# Altium project Main-Board-V1.0.0.PrjPcb (part 1 of 2)
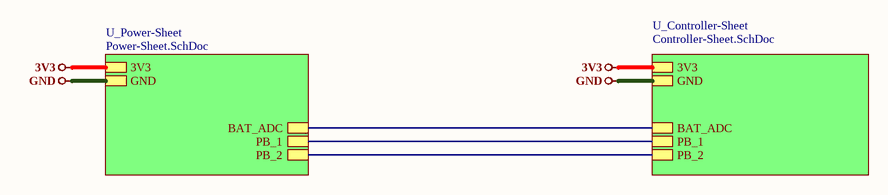
[diagram p0: Top_Sheet.SchDoc]
3 sheets, 106 parts. Net scope: hierarchical (ports join the sheet entries above them; power ports are global).
Board file: Main-Board-V1.0.0.PcbDoc
Sheets:
  Top_Sheet.SchDoc
    U_Controller-Sheet = Controller-Sheet.SchDoc
    U_Power-Sheet = Power-Sheet.SchDoc

## Sheet Top_Sheet.SchDoc
size 420 x 297 mm; SheetNumber: 1; SheetTotal: 3

### Sub-sheets
U_Controller-Sheet = Controller-Sheet.SchDoc: 3V3, GND, BAT_ADC, PB_1, PB_2
U_Power-Sheet = Power-Sheet.SchDoc: 3V3, GND, BAT_ADC, PB_1, PB_2

### Nets
3V3: sheet U_Controller-Sheet/3V3, sheet U_Power-Sheet/3V3
GND: sheet U_Controller-Sheet/GND, sheet U_Power-Sheet/GND
BATT_ADC: sheet U_Controller-Sheet/BAT_ADC, sheet U_Power-Sheet/BAT_ADC
PB_1: sheet U_Controller-Sheet/PB_1, sheet U_Power-Sheet/PB_1
PB_2: sheet U_Controller-Sheet/PB_2, sheet U_Power-Sheet/PB_2

### Notes on the sheet
- File:
- Title:
- Date:
- Page
- Num:
- Total:
- Drawn By: Huzaifa Ali

## Sheet Controller-Sheet.SchDoc
size 420 x 297 mm; SheetNumber: 3; SheetTotal: 3
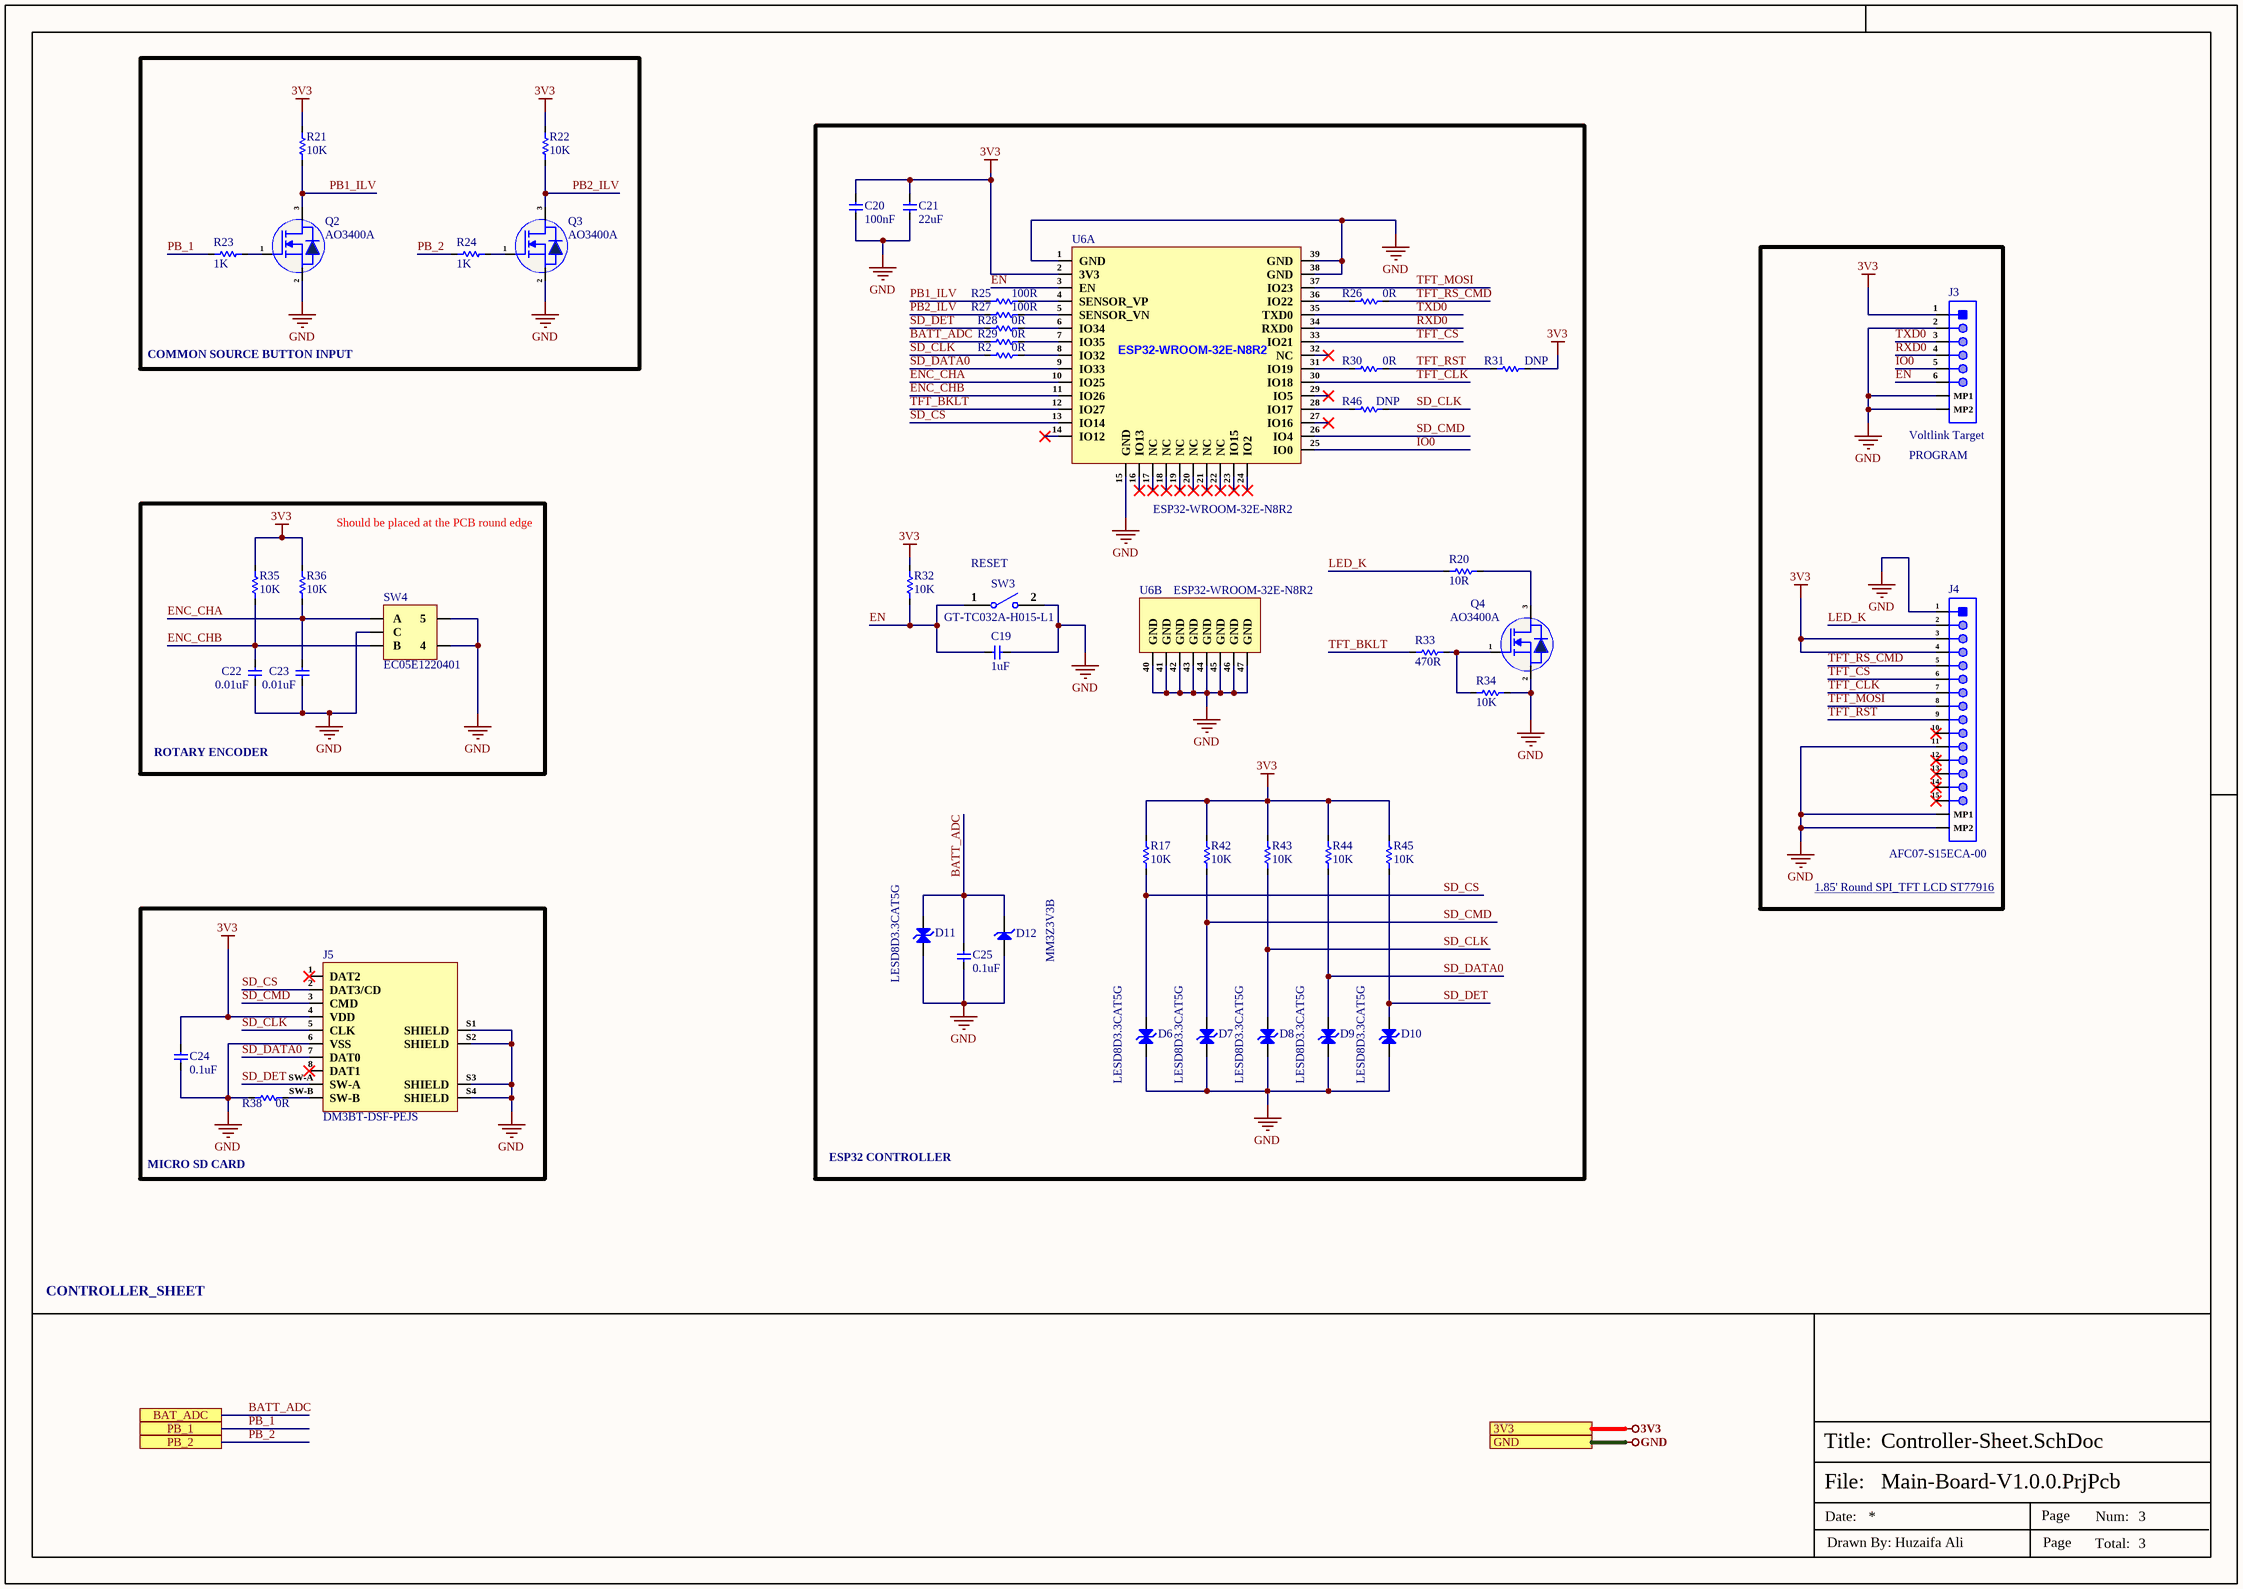
[diagram p1: Controller-Sheet.SchDoc]

### Parts
C19  1uF  [Cap-0402]
C20  100nF  [Cap-0402]
C21  22uF  [Cap-0603]
C22  0.01uF  [Cap-0402]
C23  0.01uF  [Cap-0402]
C24  0.1uF  [Cap-0402]
C25  0.1uF  [Cap-0402]
D6  LESD8D3.3CAT5G  [SOD-882 Bi Directional]
D7  LESD8D3.3CAT5G  [SOD-882 Bi Directional]
D8  LESD8D3.3CAT5G  [SOD-882 Bi Directional]
D9  LESD8D3.3CAT5G  [SOD-882 Bi Directional]
D10  LESD8D3.3CAT5G  [SOD-882 Bi Directional]
D11  LESD8D3.3CAT5G  [SOD-882 Bi Directional]
D12  MM3Z3V3B  [SOD323F]
J3  Voltlink Target  [Voltlink Target]
J4  AFC07-S15ECA-00  [AFC07-S15ECA-00]
J5  DM3BT-DSF-PEJS  [DM3BT-DSF-PEJS]
Q2  AO3400A  [sot-23]
Q3  AO3400A  [sot-23]
Q4  AO3400A  [sot-23]
R2  0R  [Res-0402]
R17  10K  [Res-0402]
R20  10R  [Res-1206]
R21  10K  [Res-0402]
R22  10K  [Res-0402]
R23  1K  [Res-0402]
R24  1K  [Res-0402]
R25  100R  [Res-0402]
R26  0R  [Res-0603]
R27  100R  [Res-0402]
R28  0R  [Res-0402]
R29  0R  [Res-0402]
R30  0R  [Res-0603]
R31  DNP  [Res-0603]
R32  10K  [Res-0402]
R33  470R  [Res-0402]
R34  10K  [Res-0402]
R35  10K  [Res-0402]
R36  10K  [Res-0402]
R38  0R  [Res-0402]
R42  10K  [Res-0402]
R43  10K  [Res-0402]
R44  10K  [Res-0402]
R45  10K  [Res-0402]
R46  DNP  [Res-0402]
SW3  GT-TC032A-H015-L1  [GT-TC032A-H015-L1]
SW4  EC05E1220401  [EC05E1220401]
U6  ESP32-WROOM-32E-N8R2  [38-SMD Module]  (parts A,B of 2)

### Blocks framed on the sheet
COMMON SOURCE BUTTON INPUT: Q2 Q3 R21-R24
MICRO SD CARD: C24 J5 R38

### Ports
3V3 (see Top_Sheet[4B], Power-Sheet[4D]), BAT_ADC (see Top_Sheet[4B], Power-Sheet[1D]), GND (see Top_Sheet[4B], Power-Sheet[4D]), PB_1 (see Top_Sheet[4B], Power-Sheet[1D]), PB_2 (see Top_Sheet[4B], Power-Sheet[1D])

### Nets
3V3: C20.2 C21.2 C24.1 J3.1 J4.3 J4.4 J5.4(VDD) R17.2 R21.2 R22.2 R31.2 R32.2 R35.2 R36.2 R42.2 R43.2 R44.2 R45.2 U6.2(3V3) ; port 3V3
GND: C19.2 C20.1 C21.1 C22.1 C23.1 C24.2 C25.1 D6.1(A) D7.1(A) D8.1(A) D9.1(A) D10.1(A) D11.1(A) D12.1(A) J3.2 J3.MP1 J3.MP2 J4.1 J4.11 J4.MP1 J4.MP2 J5.6(VSS) J5.S1(SHIELD) J5.S2(SHIELD) J5.S3(SHIELD) J5.S4(SHIELD) Q2.2(S) Q3.2(S) Q4.2(S) R34.1 R38.1 SW3.2 SW4.4 SW4.5 SW4.C U6.1(GND) U6.15(GND) U6.38(GND) U6.39(GND) U6.40(GND) U6.41(GND) U6.42(GND) U6.43(GND) U6.44(GND) U6.45(GND) U6.46(GND) U6.47(GND) ; port GND
BATT_ADC: C25.2 D11.2(A) D12.2(K) R29.1 ; port BAT_ADC
EN: C19.1 J3.6 R32.1 SW3.1 U6.3(EN)
ENC_CHA: C23.2 R36.1 SW4.A U6.10(IO25)
ENC_CHB: C22.2 R35.1 SW4.B U6.11(IO26)
IO0: J3.5 U6.25(IO0)
LED_K: J4.2 R20.1
PB1_ILV: Q2.3(D) R21.1 R25.1
PB2_ILV: Q3.3(D) R22.1 R27.1
PB_1: R23.1 ; port PB_1
PB_2: R24.1 ; port PB_2
RXD0: J3.4 U6.34(RXD0)
SD_CLK: D8.2(A) J5.5(CLK) R2.1 R43.1 R46.2
SD_CMD: D7.2(A) J5.3(CMD) R42.1 U6.26(IO4)
SD_CS: D6.2(A) J5.2(DAT3/CD) R17.1 U6.13(IO14)
SD_DATA0: D9.2(A) J5.7(DAT0) R44.1 U6.9(IO33)
SD_DET: D10.2(A) J5.SW-A R28.1 R45.1
TFT_BKLT: R33.1 U6.12(IO27)
TFT_CLK: J4.7 U6.30(IO18)
TFT_CS: J4.6 U6.33(IO21)
TFT_MOSI: J4.8 U6.37(IO23)
TFT_RS_CMD: J4.5 R26.2
TFT_RST: J4.9 R30.2 R31.1
TXD0: J3.3 U6.35(TXD0)
NetJ5_SW-B: J5.SW-B R38.2
NetQ2_1: Q2.1(G) R23.2
NetQ3_1: Q3.1(G) R24.2
NetQ4_1: Q4.1(G) R33.2 R34.2
NetQ4_3: Q4.3(D) R20.2
NetR2_2: R2.2 U6.8(IO32)
NetR25_2: R25.2 U6.4(SENSOR_VP)
NetR26_1: R26.1 U6.36(IO22)
NetR27_2: R27.2 U6.5(SENSOR_VN)
NetR28_2: R28.2 U6.6(IO34)
NetR29_2: R29.2 U6.7(IO35)
NetR30_1: R30.1 U6.31(IO19)
NetR46_1: R46.1 U6.28(IO17)

Not connected (* = marked no-connect by the designer): J4 10* 12* 13* 14* 15*; J5 1(DAT2)* 8(DAT1)*; U6 14(IO12)* 16(IO13)* 17(NC)* 18(NC)* 19(NC)* 20(NC)* 21(NC)* 22(NC)* 23(IO15)* 24(IO2)* 27(IO16)* 29(IO5)* 32(NC)*

### Notes on the sheet
- (near J3) PROGRAM
- (near R36) Should be placed at the PCB round edge
- (near SW3) RESET
- ROTARY ENCODER
- 1.85' Round SPI_TFT LCD ST77916 <https://tr.aliexpress.com/item/3256807129749103.html?spm=a2g0o.order_list.order_list_main.31.4a783d1277oQyW&gatewayAdapt=4itemAdapt#nav-specification>
- ESP32 CONTROLLER
- CONTROLLER_SHEET
- File:
- Title:
- Date:
- Page
- Num:
- Total:
- Drawn By: Huzaifa Ali

### Library data of the parts
C19 = GRM155C71C105KE11D: CAP CER 1UF 16V X7S 0402; Manufacturer: Murata; Item Type: Capacitors; Material: 4241ConductorMaterial; Tolerance: 10%; Dielectric: 1542DielectricType; Supplier: Mouser; LCSC Part Number: C576449; Manufacturer Part Number: GRM155C71C105KE11D; RoHS: No; Stock: 16102; Pricing: 1=0.11, 10=0.041, 50=0.041, 100=0.026, 1000=0.023, 10000=0.016 (USD); Case/Package: 343Case; Min Operating Temperature: -55°C; Max Operating Temperature: 125°C; Value: 1uF; Voltage Rating: 16V; Voltage Rating (DC): 16V; Length: 1mm; Width: 500um; Height: 600um; Thickness: 500um
C20 = CC0402KRX5R8BB104: CAP CER 0.1UF 25V X5R 0402; Manufacturer: Yageo; Tolerance: 10%; Item Type: Capacitor; Supplier 1: Digi-Key; Manufacturer Part Number: CC0402KRX5R8BB104; RoHS: Yes; Category: Ceramic Capacitors; Stock 1: 4598218; Pricing 1: 1=0.10000, 10=0.03800, 50=0.02100, 100=0.01710, 500=0.01224, 1000=0.00961, 2500=0.00874, 5000=0.00804 (USD); Mount: Surface Mount; Case/Package: 0402; Case Code (Metric): 1005; Case Code (Imperial): 0402; Min Operating Temperature: -55°C; Max Operating Temperature: 85°C; Voltage Rating: 25V; Packaging: Tape and Reel; Capacitance: 100nF; Voltage Rating (DC): 25V; Dielectric: X5R; Resistor Type: Ceramic; Series: CC; Length: 0.039inch; Width: 0.02inch; Thickness: 0.022inch; Depth: 0.5mm; Lead Free: Lead Free; Halogen Free: Halogen Free; RoHS Compliant: Yes; ComponentLink1URL: http://www.mouser.com/ds/2/447/UPY-GPHC_X5R_4V-to-50V_25-1131599.pdf?src-supplier=Mouser; ComponentLink1Description: http://www.mouser.com/ds/2/447/UPY-GPHC_X5R_4V-to-50V_25-1131599.pdf?src-supplier=Mouser; ComponentLink2URL: http://www.yageo.com/documents/recent/UPY-GPHC_X5R_4V-to-50V-16.pdf?src-supplier=Future+Electronics; ComponentLink2Description: http://www.yageo.com/documents/recent/UPY-GPHC_X5R_4V-to-50V-16.pdf?src-supplier=Future+Electronics; ComponentLink3URL: http://www.yageo.com/documents/recent/UPY-GPHC_X5R_4V-to-50V_25.pdf?src-supplier=Digi-Key; ComponentLink3Description: http://www.yageo.com/documents/recent/UPY-GPHC_X5R_4V-to-50V_25.pdf?src-supplier=Digi-Key; Supplier Part Number 1: 311-1697-1-ND; LCSC Part Number: C106256
C21 = CC0603MRX5R6BB226: CAP CER 22UF 10V X5R 0603; Manufacturer: Yageo; Tolerance: 20%; Item Type: Capacitor; Supplier 1: Digi-Key; Manufacturer Part Number: CC0603MRX5R6BB226; RoHS: Yes; Category: Ceramic Capacitors; Stock 1: 19628; Pricing 1: 1=0.68000, 10=0.48000, 50=0.36300, 100=0.31610, 500=0.23416, 1000=0.19903 (USD); Mount: Surface Mount; Case/Package: 0603; Case Code (Metric): 1608; Case Code (Imperial): 0603; Weight: 7.1E-05oz; Min Operating Temperature: -55°C; Max Operating Temperature: 85°C; Packaging: Tape and Reel; Capacitance: 22uF; Voltage Rating: 10V; Dielectric: X5R; Termination: SMD/SMT; Voltage Rating (DC): 10V; Package Quantity: 4000; Length: 0.063inch; Width: 0.8mm; Height: 0.8mm; Thickness: 0.035inch; Lead Free: Lead Free; Halogen Free: Halogen Free; RoHS Compliant: Yes; ComponentLink1URL: http://www.mouser.com/ds/2/447/Yageo_UPY-GP_NP0_16V-to-50V_9-358835.pdf?src-supplier=Mouser; ComponentLink1Description: http://www.mouser.com/ds/2/447/Yageo_UPY-GP_NP0_16V-to-50V_9-358835.pdf?src-supplier=Mouser; ComponentLink2URL: http://www.yageo.com/documents/recent/UPY-GPHC_X5R_4V-to-50V_25.pdf?src-supplier=Digi-Key; ComponentLink2Description: http://www.yageo.com/documents/recent/UPY-GPHC_X5R_4V-to-50V_25.pdf?src-supplier=Digi-Key; Supplier Part Number 1: 311-1819-1-ND; LCSC Part Number: C109447
C22 C23 = CC0402KRX5R8BB103: CAP CER 10000PF 25V X5R 0402; Manufacturer: Yageo; Item Type: Capacitor; Supplier 1: Future Electronics; Manufacturer Part Number: CC0402KRX5R8BB103; RoHS: Yes; Category: Ceramic Capacitors; Stock 1: 140000; Pricing 1: 10000=0.00290, 40000=0.00270, 150000=0.00260, 250000=0.00250, 500000=0.00240 (USD); RoHS Compliant: Yes; Supplier Part Number 1: 2101932; LCSC Part Number: C576726; ComponentLink1Description: LCSC; ComponentLink1URL: https://www.lcsc.com/product-detail/Multilayer-Ceramic-Capacitors-MLCC-SMD-SMT_YAGEO-CC0402KRX5R8BB103_C576726.html
C24 C25 = CC0402JRX7R7BB104: CAP CER 0.1UF 16V X7R 0402; Manufacturer: Yageo; Material: 4241ConductorMaterial; Value: 100nF; Tolerance: 5%; Item Type: Capacitor; Supplier: Digikey; Supplier Part Number: 311-1676-1-ND; Manufacturer Part Number: CC0402JRX7R7BB104; RoHS: Yes; Category: Ceramic Capacitors; Stock: 1659111; Pricing: 1=0.1, 10=0.046, 50=0.0262, 100=0.0203, 500=0.01528, 1000=0.012, 2500=0.01091, 5000=0.01004 (USD); Mounting Technology: Surface Mount; Case/Package: 0402; Case Code (Metric): 1005; Case Code (Imperial): 0402; Min Operating Temperature: -55°C; Max Operating Temperature: 125°C; Dielectric: X7R; Packaging: Tape and Reel; Package Quantity: 10000; Voltage Rating (DC): 16V; Voltage Rating: 16V; Series: CC; Construction: Flat; Length: 0.039inch; Width: 0.02inch; Height: 0.5mm; Thickness: 0.022inch; Lead Free: Lead Free; Halogen Free: Halogen Free; RoHS Compliant: Yes; ComponentLink1URL: https://datasheet.ciiva.com/13210/upy-gphc-x7r-6-3v-to-50v-8-12304-13210152.pdf?src-supplier=Mouser; ComponentLink1Description: https://datasheet.ciiva.com/13210/upy-gphc-x7r-6-3v-to-50v-8-12304-13210152.pdf?src-supplier=Mouser; LCSC Part Number: C541464
D6-D11 = LESD8D3.3CAT5G: 5V 10V 3.3V Bi-Directional SOD-882 ESD Protection Devices ROHS; Manufacturer: LRC; Manufacturer Part Number: LESD8D3.3CAT5G; Package: SOD-882; LCSC Part Number: C172409; Item Type: Protection Device; ComponentLink1Description: LCSC; ComponentLink1URL: https://www.lcsc.com/product-detail/span-style-background-color-ff0-ESD-span-Protection-Devices_LRC-LESD8D3-3CAT5G_C172409.html
D12 = MM3Z3V3B: DIODE ZENER 3.3V 200MW SOD323F; Manufacturer: ON Semiconductor / Fairchild; Forward Voltage: 1V; Tolerance: 2%; Impedance: 89R; Max Reverse Leakage Current: 4.5uA; Test Current: 5mA; Element Configuration: Single; Supplier 1: Digi-Key; Manufacturer Part Number: MM3Z3V3B; Stock 1: 473644; Pricing 1: 1=0.22, 10=0.18, 100=0.0956, 500=0.06288, 1000=0.04276 (USD); Mount: Surface Mount; Number of Pins: 2; Weight: 0.0276g; Min Operating Temperature: -65°C; Max Operating Temperature: 150°C; Packaging: Tape and Reel; Package Quantity: 1; Max Power Dissipation: 200mW; Zener Voltage: 3.3V; Voltage Tolerance: 2%; Power Dissipation: 200mW; Working Voltage: 3.3V; Peak Reverse Current: 4.5uA; Length: 1.3mm; Height: 1mm; Width: 1.7mm; Radiation Hardening: No; REACH SVHC: No SVHC; Lead Free: Lead Free; ComponentLink1URL: http://www.onsemi.com/pub/Collateral/MM3Z9V1B-D.pdf?src-supplier=Digi-Key; ComponentLink1Description: http://www.onsemi.com/pub/Collateral/MM3Z9V1B-D.pdf?src-supplier=Digi-Key; ComponentLink2URL: http://www.mouser.com/ds/2/149/MM3Z3V3B-187166.pdf?src-supplier=Mouser; ComponentLink2Description: http://www.mouser.com/ds/2/149/MM3Z3V3B-187166.pdf?src-supplier=Mouser; ComponentLink3URL: https://www.fairchildsemi.com/datasheets/MM/MM3Z9V1B.pdf?src-supplier=Avnet; ComponentLink3Description: https://www.fairchildsemi.com/datasheets/MM/MM3Z9V1B.pdf?src-supplier=Avnet; ComponentLink4URL: http://www.farnell.com/datasheets/1706525.pdf?src-supplier=Element14; ComponentLink4Description: http://www.farnell.com/datasheets/1706525.pdf?src-supplier=Element14; Supplier Part Number 1: MM3Z3V3BCT-ND; LCSC Part Number: C2978865; Item Type: Diode
J3 = C145963: 1x6P SH 1 1mm 6 SMD,P=1mm Wire To Board / Wire To Wire Connector ROHS; Manufacturer: BOOMELE; Manufacturer Part Number: C145963; Package: SMD,P=1mm; LCSC Part Number: C145963; Item Type: Connector; ComponentLink1Description: LCSC; ComponentLink1URL: https://www.lcsc.com/product-detail/Wire-To-Board-Wire-To-Wire-Connector_BOOMELE-Boom-Precision-Elec-C145963_C145963.html
J4 = AFC07-S15ECA-00: SMD,P=0.5mm,Surface Mount，Right Angle; Manufacturer: JUSHUO; Item Type: FFC, FPC Connector; Manufacturer Part Number: AFC07-S15ECA-00; Package: SMD,P=0.5mm,Surface Mount，Right Angle; LCSC Part Number: C262588; ComponentLink1Description: LCSC; ComponentLink1URL: https://www.lcsc.com/product-detail/FFC-FPC-Flat-Flexible-Connector-Assemblies_JUSHUO-AFC07-S15ECA-00_C262588.html
J5 = DM3BT-DSF-PEJS: CONN MICRO SD CARD PUSH-PUSH R/A; Manufacturer: Hirose; Max Current Rating: 500mA; Contact Resistance: 100mR; Voltage Rating (AC): 125V; Gender: Female; Number of Contacts: 8; Connector Type: Connector,Socket; Insulation Resistance: 1GR; Pitch: 1.1mm; Item Type: SD Card Connector; Supplier 1: Future Electronics; Manufacturer Part Number: DM3BT-DSF-PEJS; RoHS: Yes; Category: Memory Connectors; Stock 1: 9600; Pricing 1: 1200=1.39000 (USD); Mount: Surface Mount,Reverse; Contact Material: Copper Alloy,Copper; Contact Plating: Gold; Housing Material: Polymer; Min Operating Temperature: -25°C; Max Operating Temperature: 85°C; Number of Rows: 1; Packaging: Tape and Reel; Current Rating: 500mA; Package Quantity: 1; Termination: Solder; Max Voltage Rating (AC): 125V; Number of Positions: 8; Orientation: Right Angle; Series: DM3; Length: 13.85mm; Width: 16.05mm; Depth: 1.83mm; Radiation Hardening: No; Reach SVHC Compliant: Yes; Lead Free: Lead Free; Flammability Rating: UL94 V-0; RoHS Compliant: Yes; ComponentLink1URL: https://datasheet.ciiva.com/683/doc-1806131255093-683387.pdf?src-supplier=Digi-Key; ComponentLink1Description: https://datasheet.ciiva.com/683/doc-1806131255093-683387.pdf?src-supplier=Digi-Key; Supplier Part Number 1: 3000978; LCSC Part Number: C597972
Q2-Q4 = AO3400A: 30V 5.8A 32mΩ@10V,5.8A 1.4W 1.4V@250uA N Channel SOT-23 MOSFETs ROHS; Manufacturer: BORN; Item Type: Mosfet; ComponentLink1Description: LCSC; ComponentLink1URL: https://www.lcsc.com/product-detail/MOSFETs_BORN-AO3400A_C344010.html; Manufacturer Part Number: AO3400A; Footprint: SOT-23; LCSC Part Number: C344010
R2 R28 R29 R38 = RC0402FR-070RL: RES 0 OHM JUMPER 1/16W 0402; Manufacturer: Yageo; Item Type: Resistors; Tolerance: 1%; Power Rating: 62.5mW; Voltage Rating: 50V; Temperature Coefficient: 200ppm/°C; Max Power Dissipation: 63mW; Supplier 1: Mouser; Manufacturer Part Number: RC0402FR-070RL; RoHS: Yes; Stock 1: 8556842; Pricing 1: 1=0.10000, 10=0.01400, 50=0.01400, 100=0.00600, 1000=0.00300, 5000=0.00200, 10000=0.00100 (USD); Mount: Surface Mount; Case/Package: 0402; Contact Plating: Tin,Matte; Case Code (Imperial): 0402; Case Code (Metric): 1005; Size Code: 0402; Min Operating Temperature: -55°C; Max Operating Temperature: 155°C; Resistance: 0R; Resistor Type: Thick Film; Packaging: Tape and Reel; Termination: SMD/SMT; Features: Moisture Resistant; Series: RC; Number of Terminations: 2; Length: 1mm; Width: 0.5mm; Height: 0.35mm; Radiation Hardening: No; Lead Free: Lead Free; RoHS Compliant: Yes; ComponentLink1URL: https://datasheet.ciiva.com/8896/pyu-rc0402-51-rohs-l-6-8896149.pdf?src-supplier=Avnet; ComponentLink1Description: https://datasheet.ciiva.com/8896/pyu-rc0402-51-rohs-l-6-8896149.pdf?src-supplier=Avnet; ComponentLink2URL: https://datasheet.ciiva.com/16790/pyu-rc0402-51-rohs-l-6-r-16790444.pdf?src-supplier=Future+Electronics; ComponentLink2Description: https://datasheet.ciiva.com/16790/pyu-rc0402-51-rohs-l-6-r-16790444.pdf?src-supplier=Future+Electronics; Supplier Part Number 1: 603-RC0402FR-070RL; LCSC Part Number: C106231
R17 R21 R22 R32 R34-R36 R42-R45 = RC0402FR-0710KL: RES 10K OHM 1% 1/16W 0402; Manufacturer: Yageo; Resistance: 10kR; Voltage Rating (DC): 50V; Temperature Coefficient: 100ppm/°C; Power Rating: 62.5mW; Max Power Dissipation: 63mW; Item Type: Resistor; Supplier 1: Mouser; Manufacturer Part Number: RC0402FR-0710KL; RoHS: Yes; Category: Chip SMD Resistors; Stock 1: 18648329; Pricing 1: 1=0.10000, 10=0.01400, 50=0.01400, 100=0.00500, 1000=0.00300, 10000=0.00200 (USD); Case/Package: 0402; Number of Pins: 2; Case Code (Imperial): 0402; Case Code (Metric): 1005; Min Operating Temperature: -55°C; Max Operating Temperature: 155°C; Resistor Type: Thick Film; Tolerance: 1%; Packaging: Tape and Reel; Voltage Rating: 50V; Termination: SMD/SMT; Working Voltage: 50V; Number of Terminations: 2; Features: Moisture Resistant; Series: RC; Resistance Tolerance: 1%; Construction: Rectangular; Length: 1mm; Width: 0.5mm; Height: 0.32mm; Depth: 0.5mm; Lead Pitch: 0.2mm; REACH SVHC: No SVHC; Lead Free: Lead Free; RoHS Compliant: Yes; Military Standard: Not; ComponentLink1URL: https://datasheet.ciiva.com/7660/38568-7660787.pdf?src-supplier=Element14; ComponentLink1Description: https://datasheet.ciiva.com/7660/38568-7660787.pdf?src-supplier=Element14; ComponentLink2URL: https://datasheet.ciiva.com/7849/1686128-7849814.pdf?src-supplier=Element14; ComponentLink2Description: https://datasheet.ciiva.com/7849/1686128-7849814.pdf?src-supplier=Element14; ComponentLink3URL: https://datasheet.ciiva.com/7983/1018594-7983486.pdf?src-supplier=Element14; ComponentLink3Description: https://datasheet.ciiva.com/7983/1018594-7983486.pdf?src-supplier=Element14; ComponentLink4URL: https://datasheet.ciiva.com/22747/1018594-22747512.pdf?src-supplier=Element14; ComponentLink4Description: https://datasheet.ciiva.com/22747/1018594-22747512.pdf?src-supplier=Element14; ComponentLink5URL: https://datasheet.ciiva.com/12667/pyu-rc0402-51-rohs-l-6-r-12667067.pdf?src-supplier=Mouser; ComponentLink5Description: https://datasheet.ciiva.com/12667/pyu-rc0402-51-rohs-l-6-r-12667067.pdf?src-supplier=Mouser; ComponentLink6URL: https://datasheet.ciiva.com/7849/1784430-7849813.pdf?src-supplier=Element14; ComponentLink6Description: https://datasheet.ciiva.com/7849/1784430-7849813.pdf?src-supplier=Element14; ComponentLink7URL: https://datasheet.ciiva.com/7849/1784430-7849815.pdf?src-supplier=Element14; ComponentLink7Description: https://datasheet.ciiva.com/7849/1784430-7849815.pdf?src-supplier=Element14; Supplier Part Number 1: 603-RC0402FR-0710KL; LCSC Part Number: C60490
R20 = RC1206FR-0710RL: RES 10 OHM 1% 1/4W 1206; Manufacturer: Yageo; Item Type: Resistor; Voltage Rating (AC): 200V; Supplier: Avnet; LCSC Part Number: C108080; Manufacturer Part Number: RC1206FR-0710RL; RoHS: Yes; Stock: 3696; Pricing: 1=0.125, 25=0.043, 50=0.034, 100=0.026 (USD); Lead Free: 5697LeadFree; ComponentLink1URL: https://datasheet.ciiva.com/11819/0900766b80c6630a-11819896.pdf?src-supplier=Rs; ComponentLink1Description: https://datasheet.ciiva.com/11819/0900766b80c6630a-11819896.pdf?src-supplier=Rs; ComponentLink2URL: https://datasheet.ciiva.com/22735/444357-22735648.pdf?src-supplier=Farnell; ComponentLink2Description: https://datasheet.ciiva.com/22735/444357-22735648.pdf?src-supplier=Farnell; ComponentLink3URL: https://datasheet.ciiva.com/29181/402303-da-01-en-smd-widerstand-chip1206-10-ohm-29181572.pdf?src-supplier=Conrad; ComponentLink3Description: https://datasheet.ciiva.com/29181/402303-da-01-en-smd-widerstand-chip1206-10-ohm-29181572.pdf?src-supplier=Conrad; ComponentLink4URL: https://datasheet.ciiva.com/2460/pyu-rc1206-51-rohs-l-4-2460048.pdf?src-supplier=Digikey; ComponentLink4Description: https://datasheet.ciiva.com/2460/pyu-rc1206-51-rohs-l-4-2460048.pdf?src-supplier=Digikey; ComponentLink5URL: https://datasheet.ciiva.com/2460/pyu-rc1206-51-rohs-l-4-2460049.pdf?src-supplier=Digikey; ComponentLink5Description: https://datasheet.ciiva.com/2460/pyu-rc1206-51-rohs-l-4-2460049.pdf?src-supplier=Digikey; ComponentLink6URL: https://datasheet.ciiva.com/2460/pyu-rc1206-51-rohs-l-4-2460050.pdf?src-supplier=Digikey; ComponentLink6Description: https://datasheet.ciiva.com/2460/pyu-rc1206-51-rohs-l-4-2460050.pdf?src-supplier=Digikey; ComponentLink7URL: https://datasheet.ciiva.com/46445/444357-46445704.pdf?src-supplier=Element14; ComponentLink7Description: https://datasheet.ciiva.com/46445/444357-46445704.pdf?src-supplier=Element14; ComponentLink8URL: https://datasheet.ciiva.com/16962/pyu-rc1206-51-rohs-l-4-16962857.pdf?src-supplier=Future+Electronics; ComponentLink8Description: https://datasheet.ciiva.com/16962/pyu-rc1206-51-rohs-l-4-16962857.pdf?src-supplier=Future+Electronics
R23 R24 = RC0402FR-071KL: RES 1K OHM 1% 1/16W 0402; Manufacturer: Yageo; Resistance: 1kR; Temperature Coefficient: 100ppm/°C; Voltage Rating (DC): 50V; Power Rating: 62.5mW; Max Power Dissipation: 63mW; Item Type: Resistor; Supplier 1: Avnet; Manufacturer Part Number: RC0402FR-071KL; RoHS: Yes; Category: Chip SMD Resistors; Stock 1: 13030000; Pricing 1: 10000=0.00085, 20000=0.00087, 40000=0.00084, 60000=0.00083, 80000=0.00079, 100000=0.00078, 1000000=0.00076 (USD); Case/Package: 0402; Number of Pins: 2; Case Code (Imperial): 0402; Case Code (Metric): 1005; Size Code: 0402; Min Operating Temperature: -55°C; Max Operating Temperature: 155°C; Resistor Type: Thick Film; Tolerance: 1%; Packaging: Tape and Reel; Voltage Rating: 50V; Termination: SMD/SMT; Features: Moisture Resistant; Series: RC; Number of Terminations: 2; Resistance Tolerance: 1%; Construction: Rectangular; Technology: THICK FILM; Length: 1mm; Width: 0.5mm; Height: 0.32mm; Depth: 0.5mm; Reach SVHC Compliant: Yes; Lead Free: Lead Free; RoHS Compliant: Yes; Military Standard: Not; ComponentLink1URL: https://datasheet.ciiva.com/11819/0900766b80c66297-11819477.pdf?src-supplier=RSComponents; ComponentLink1Description: https://datasheet.ciiva.com/11819/0900766b80c66297-11819477.pdf?src-supplier=RSComponents; ComponentLink2URL: https://datasheet.ciiva.com/7983/1018594-7983502.pdf?src-supplier=Element14; ComponentLink2Description: https://datasheet.ciiva.com/7983/1018594-7983502.pdf?src-supplier=Element14; ComponentLink3URL: https://datasheet.ciiva.com/22747/1018594-22747513.pdf?src-supplier=Element14; ComponentLink3Description: https://datasheet.ciiva.com/22747/1018594-22747513.pdf?src-supplier=Element14; ComponentLink4URL: https://datasheet.ciiva.com/12666/pyu-rc0402-51-rohs-l-6-r-12666741.pdf?src-supplier=Mouser; ComponentLink4Description: https://datasheet.ciiva.com/12666/pyu-rc0402-51-rohs-l-6-r-12666741.pdf?src-supplier=Mouser; ComponentLink5URL: https://datasheet.ciiva.com/7849/1018594-7849869.pdf?src-supplier=Element14; ComponentLink5Description: https://datasheet.ciiva.com/7849/1018594-7849869.pdf?src-supplier=Element14; ComponentLink6URL: https://datasheet.ciiva.com/7849/1018594-7849871.pdf?src-supplier=Element14; ComponentLink6Description: https://datasheet.ciiva.com/7849/1018594-7849871.pdf?src-supplier=Element14; ComponentLink7URL: https://datasheet.ciiva.com/17063/pyu-rc0402-51-rohs-l-6-r-17063193.pdf?src-supplier=Future+Electronics; ComponentLink7Description: https://datasheet.ciiva.com/17063/pyu-rc0402-51-rohs-l-6-r-17063193.pdf?src-supplier=Future+Electronics; Supplier Part Number 1: RC0402FR-071KL; LCSC Part Number: C106235
R25 R27 = RC0402FR-07100RL: RES 100 OHM 1% 1/16W 0402; Manufacturer: Yageo; Power Rating: 62.5mW; Voltage Rating: 50V; Temperature Coefficient: 100ppm/°C; Max Power Dissipation: 63mW; Item Type: Resistor; Supplier 1: Mouser; Manufacturer Part Number: RC0402FR-07100RL; RoHS: Yes; Category: Chip SMD Resistors; Stock 1: 699545; Pricing 1: 1=0.10000, 10=0.01200, 50=0.01200, 100=0.00500, 1000=0.00300, 2500=0.00200, 10000=0.00100 (USD); Case/Package: 0402; Number of Pins: 2; Case Code (Imperial): 0402; Case Code (Metric): 1005; Size Code: 0402; Min Operating Temperature: -55°C; Max Operating Temperature: 155°C; Tolerance: 1%; Voltage Rating (DC): 50V; Resistance: 100R; Packaging: Tape and Reel; Termination: SMD/SMT; Resistor Type: Thick Film; Features: Moisture Resistant; Series: RC; Number of Terminations: 2; Resistance Tolerance: 1%; Construction: Rectangular; Technology: THICK FILM; Length: 1mm; Width: 0.5mm; Height: 0.32mm; Depth: 0.5mm; RoHS Compliant: Yes; REACH SVHC: No SVHC; Military Standard: Not; Lead Free: Lead Free; ComponentLink1URL: https://datasheet.ciiva.com/11808/0900766b80c66297-11808765.pdf?src-supplier=RSComponents; ComponentLink1Description: https://datasheet.ciiva.com/11808/0900766b80c66297-11808765.pdf?src-supplier=RSComponents; ComponentLink2URL: https://datasheet.ciiva.com/7849/1784430-7849810.pdf?src-supplier=Element14; ComponentLink2Description: https://datasheet.ciiva.com/7849/1784430-7849810.pdf?src-supplier=Element14; ComponentLink3URL: https://datasheet.ciiva.com/28367/1018594-28367226.pdf?src-supplier=Element14; ComponentLink3Description: https://datasheet.ciiva.com/28367/1018594-28367226.pdf?src-supplier=Element14; ComponentLink4URL: https://datasheet.ciiva.com/22747/1018594-22747511.pdf?src-supplier=Element14; ComponentLink4Description: https://datasheet.ciiva.com/22747/1018594-22747511.pdf?src-supplier=Element14; ComponentLink5URL: https://datasheet.ciiva.com/12667/pyu-rc0402-51-rohs-l-6-r-12667957.pdf?src-supplier=Mouser; ComponentLink5Description: https://datasheet.ciiva.com/12667/pyu-rc0402-51-rohs-l-6-r-12667957.pdf?src-supplier=Mouser; ComponentLink6URL: https://datasheet.ciiva.com/15189/getdatasheetpartid-329466-15189335.pdf?src-supplier=Verical; ComponentLink6Description: https://datasheet.ciiva.com/15189/getdatasheetpartid-329466-15189335.pdf?src-supplier=Verical; ComponentLink7URL: https://datasheet.ciiva.com/16740/pyu-rc0402-51-rohs-l-6-r-16740566.pdf?src-supplier=Future+Electronics; ComponentLink7Description: https://datasheet.ciiva.com/16740/pyu-rc0402-51-rohs-l-6-r-16740566.pdf?src-supplier=Future+Electronics; Supplier Part Number 1: 603-RC0402FR-07100RL; LCSC Part Number: C106232
R26 R30 R31 = RC0603JR-070RL: RES 0 OHM JUMPER 1/10W 0603; Manufacturer: Yageo; Resistance: 0mR; Tolerance: 1%; Power Rating: 100mW; Voltage Rating (DC): 50V; Temperature Coefficient: 200ppm/°C; Resistance Tolerance: 5%; Item Type: Resistor; Supplier 1: Digi-Key; Manufacturer Part Number: RC0603JR-070RL; RoHS: Yes; Category: Chip SMD Resistors; Stock 1: 18081776; Pricing 1: 1=0.10000, 10=0.01700, 25=0.01240, 50=0.00960, 100=0.00700, 250=0.00536, 500=0.00430, 1000=0.00316 (USD); Case/Package: 0603; Number of Pins: 2; Contact Plating: Tin,Matte; Case Code (Imperial): 0603; Case Code (Metric): 1608; Size Code: 0603; Min Operating Temperature: -55°C; Max Operating Temperature: 155°C; Resistor Type: Thick Film; Packaging: Tape and Reel; Termination: SMD/SMT; Series: RC; Technology: THICK FILM; Package Quantity: 5000; Voltage Rating: 50V; Features: Moisture Resistant; Max Power Dissipation: 100mW; Number of Terminations: 2; Construction: Rectangular; Length: 1.6mm; Width: 0.8mm; Height: 0.45mm; Depth: 0.8mm; Radiation Hardening: No; Reach SVHC Compliant: No SVHC; Lead Free: Lead Free; RoHS Compliant: Yes; Military Standard: Not; Supplier Part Number 1: 311-0.0GRCT-ND; LCSC Part Number: C95177
R33 = RC0402FR-07470RL: RES 470 OHM 1% 1/16W 0402; Manufacturer: Yageo; Item Type: Resistor; Voltage Rating: 50V; Power Rating: 62.5mW; Temperature Coefficient: 100ppm/°C; Max Power Dissipation: 63mW; Supplier: Avnet; Supplier Part Number: RC0402FR-07470RL; Manufacturer Part Number: RC0402FR-07470RL; RoHS: Yes; Stock: 10000; Pricing: 10000=0.00085 (USD); Case/Package: 0402; Case Code (Metric): 1005; Case Code (Imperial): 0402; Min Operating Temperature: -55°C; Max Operating Temperature: 155°C; Packaging: Tape and Reel; Value: 470R; Tolerance: 1%; Number of Terminations: 2; Working Voltage: 50V; Package Quantity: 1; Resistor Type: Thick Film; Termination: SMD/SMT; Features: Moisture Resistant; Series: RC; Resistance Tolerance: 1%; Construction: Rectangular; Voltage Rating (AC): 50V; Length: 1mm; Width: 0.02inch; Height: 0.016inch; Depth: 0.5mm; Lead Free: Lead Free; Reach SVHC Compliant: No; RoHS Compliant: Yes; Military Standard: Not; ComponentLink1URL: https://datasheet.ciiva.com/46412/1018594-46412838.pdf?src-supplier=Element14; ComponentLink1Description: https://datasheet.ciiva.com/46412/1018594-46412838.pdf?src-supplier=Element14; ComponentLink2URL: https://datasheet.ciiva.com/2453/pyu-r-int-thick-7-2453377.pdf?src-supplier=Digikey; ComponentLink2Description: https://datasheet.ciiva.com/2453/pyu-r-int-thick-7-2453377.pdf?src-supplier=Digikey; ComponentLink3URL: https://datasheet.ciiva.com/2453/pyu-r-int-thick-7-2453378.pdf?src-supplier=Digikey; ComponentLink3Description: https://datasheet.ciiva.com/2453/pyu-r-int-thick-7-2453378.pdf?src-supplier=Digikey; ComponentLink4URL: https://datasheet.ciiva.com/2453/pyu-r-int-thick-7-2453376.pdf?src-supplier=Digikey; ComponentLink4Description: https://datasheet.ciiva.com/2453/pyu-r-int-thick-7-2453376.pdf?src-supplier=Digikey; ComponentLink5URL: https://datasheet.ciiva.com/7850/1018594-7850015.pdf?src-supplier=Element14; ComponentLink5Description: https://datasheet.ciiva.com/7850/1018594-7850015.pdf?src-supplier=Element14; ComponentLink6URL: https://datasheet.ciiva.com/7850/1018594-7850014.pdf?src-supplier=Element14; ComponentLink6Description: https://datasheet.ciiva.com/7850/1018594-7850014.pdf?src-supplier=Element14; ComponentLink7URL: https://datasheet.ciiva.com/15189/getdatasheetpartid-330246-15189463.pdf?src-supplier=Verical; ComponentLink7Description: https://datasheet.ciiva.com/15189/getdatasheetpartid-330246-15189463.pdf?src-supplier=Verical; LCSC Part Number: C114877
R46 = RC0402FR-070RL: RES 0 OHM JUMPER 1/16W 0402; Manufacturer: Yageo; Item Type: Resistors; Resistance: 0R; Tolerance: 1%; Power Rating: 62.5mW; Voltage Rating: 50V; Temperature Coefficient: 200ppm/°C; Max Power Dissipation: 63mW; Supplier 1: Mouser; Manufacturer Part Number: RC0402FR-070RL; RoHS: Yes; Stock 1: 8556842; Pricing 1: 1=0.10000, 10=0.01400, 50=0.01400, 100=0.00600, 1000=0.00300, 5000=0.00200, 10000=0.00100 (USD); Mount: Surface Mount; Case/Package: 0402; Contact Plating: Tin,Matte; Case Code (Imperial): 0402; Case Code (Metric): 1005; Size Code: 0402; Min Operating Temperature: -55°C; Max Operating Temperature: 155°C; Resistor Type: Thick Film; Packaging: Tape and Reel; Termination: SMD/SMT; Features: Moisture Resistant; Series: RC; Number of Terminations: 2; Length: 1mm; Width: 0.5mm; Height: 0.35mm; Radiation Hardening: No; Lead Free: Lead Free; RoHS Compliant: Yes; ComponentLink1URL: https://datasheet.ciiva.com/8896/pyu-rc0402-51-rohs-l-6-8896149.pdf?src-supplier=Avnet; ComponentLink1Description: https://datasheet.ciiva.com/8896/pyu-rc0402-51-rohs-l-6-8896149.pdf?src-supplier=Avnet; ComponentLink2URL: https://datasheet.ciiva.com/16790/pyu-rc0402-51-rohs-l-6-r-16790444.pdf?src-supplier=Future+Electronics; ComponentLink2Description: https://datasheet.ciiva.com/16790/pyu-rc0402-51-rohs-l-6-r-16790444.pdf?src-supplier=Future+Electronics; Supplier Part Number 1: 603-RC0402FR-070RL; LCSC Part Number: C106231
SW3 = GT-TC032A-H015-L1: None Without bracket 50mA 3.05mm 100000 Times 12V 160gf 2.5mm 1.5mm Round Button Standing paste SPST SMD Tactile Switches ROHS; Manufacturer: G-Switch; Item Type: Switch; Manufacturer Part Number: GT-TC032A-H015-L1; Package: SMD; LCSC Part Number: C843684; ComponentLink1Description: LCSC; ComponentLink1URL: https://www.lcsc.com/product-detail/Tactile-Switches_G-Switch-GT-TC032A-H015-L1_C843684.html?s_z=n_B3U-1000P
SW4 = EC05E1220401: SMD Rotary Encoders ROHS; Manufacturer: ALPSALPINE; Manufacturer Part Number: EC05E1220401; Package: SMD; LCSC Part Number: C116648; Item Type: Rotary Encoders; ComponentLink1Description: LCSC; ComponentLink1URL: https://www.lcsc.com/product-detail/Rotary-Encoders_ALPSALPINE-EC05E1220401_C116648.html?s_z=n_EC05E1220401
U6 = ESP32-WROOM-32E-N8R2: RF TXRX MODULE BT PCB TRACE SMD; Manufacturer: Espressif Systems; Supplier: Digikey; Supplier Part Number: 1965-ESP32-WROOM-32E-N8R2DKR-ND; Manufacturer Part Number: ESP32-WROOM-32E-N8R2; RoHS: No; Category: Uncategorized; Pricing: 1=2.88 (USD); LCSC Part Number: C5361945; Item Type: Module

## Sheet Power-Sheet.SchDoc
size 420 x 297 mm; SheetNumber: 2; SheetTotal: 3
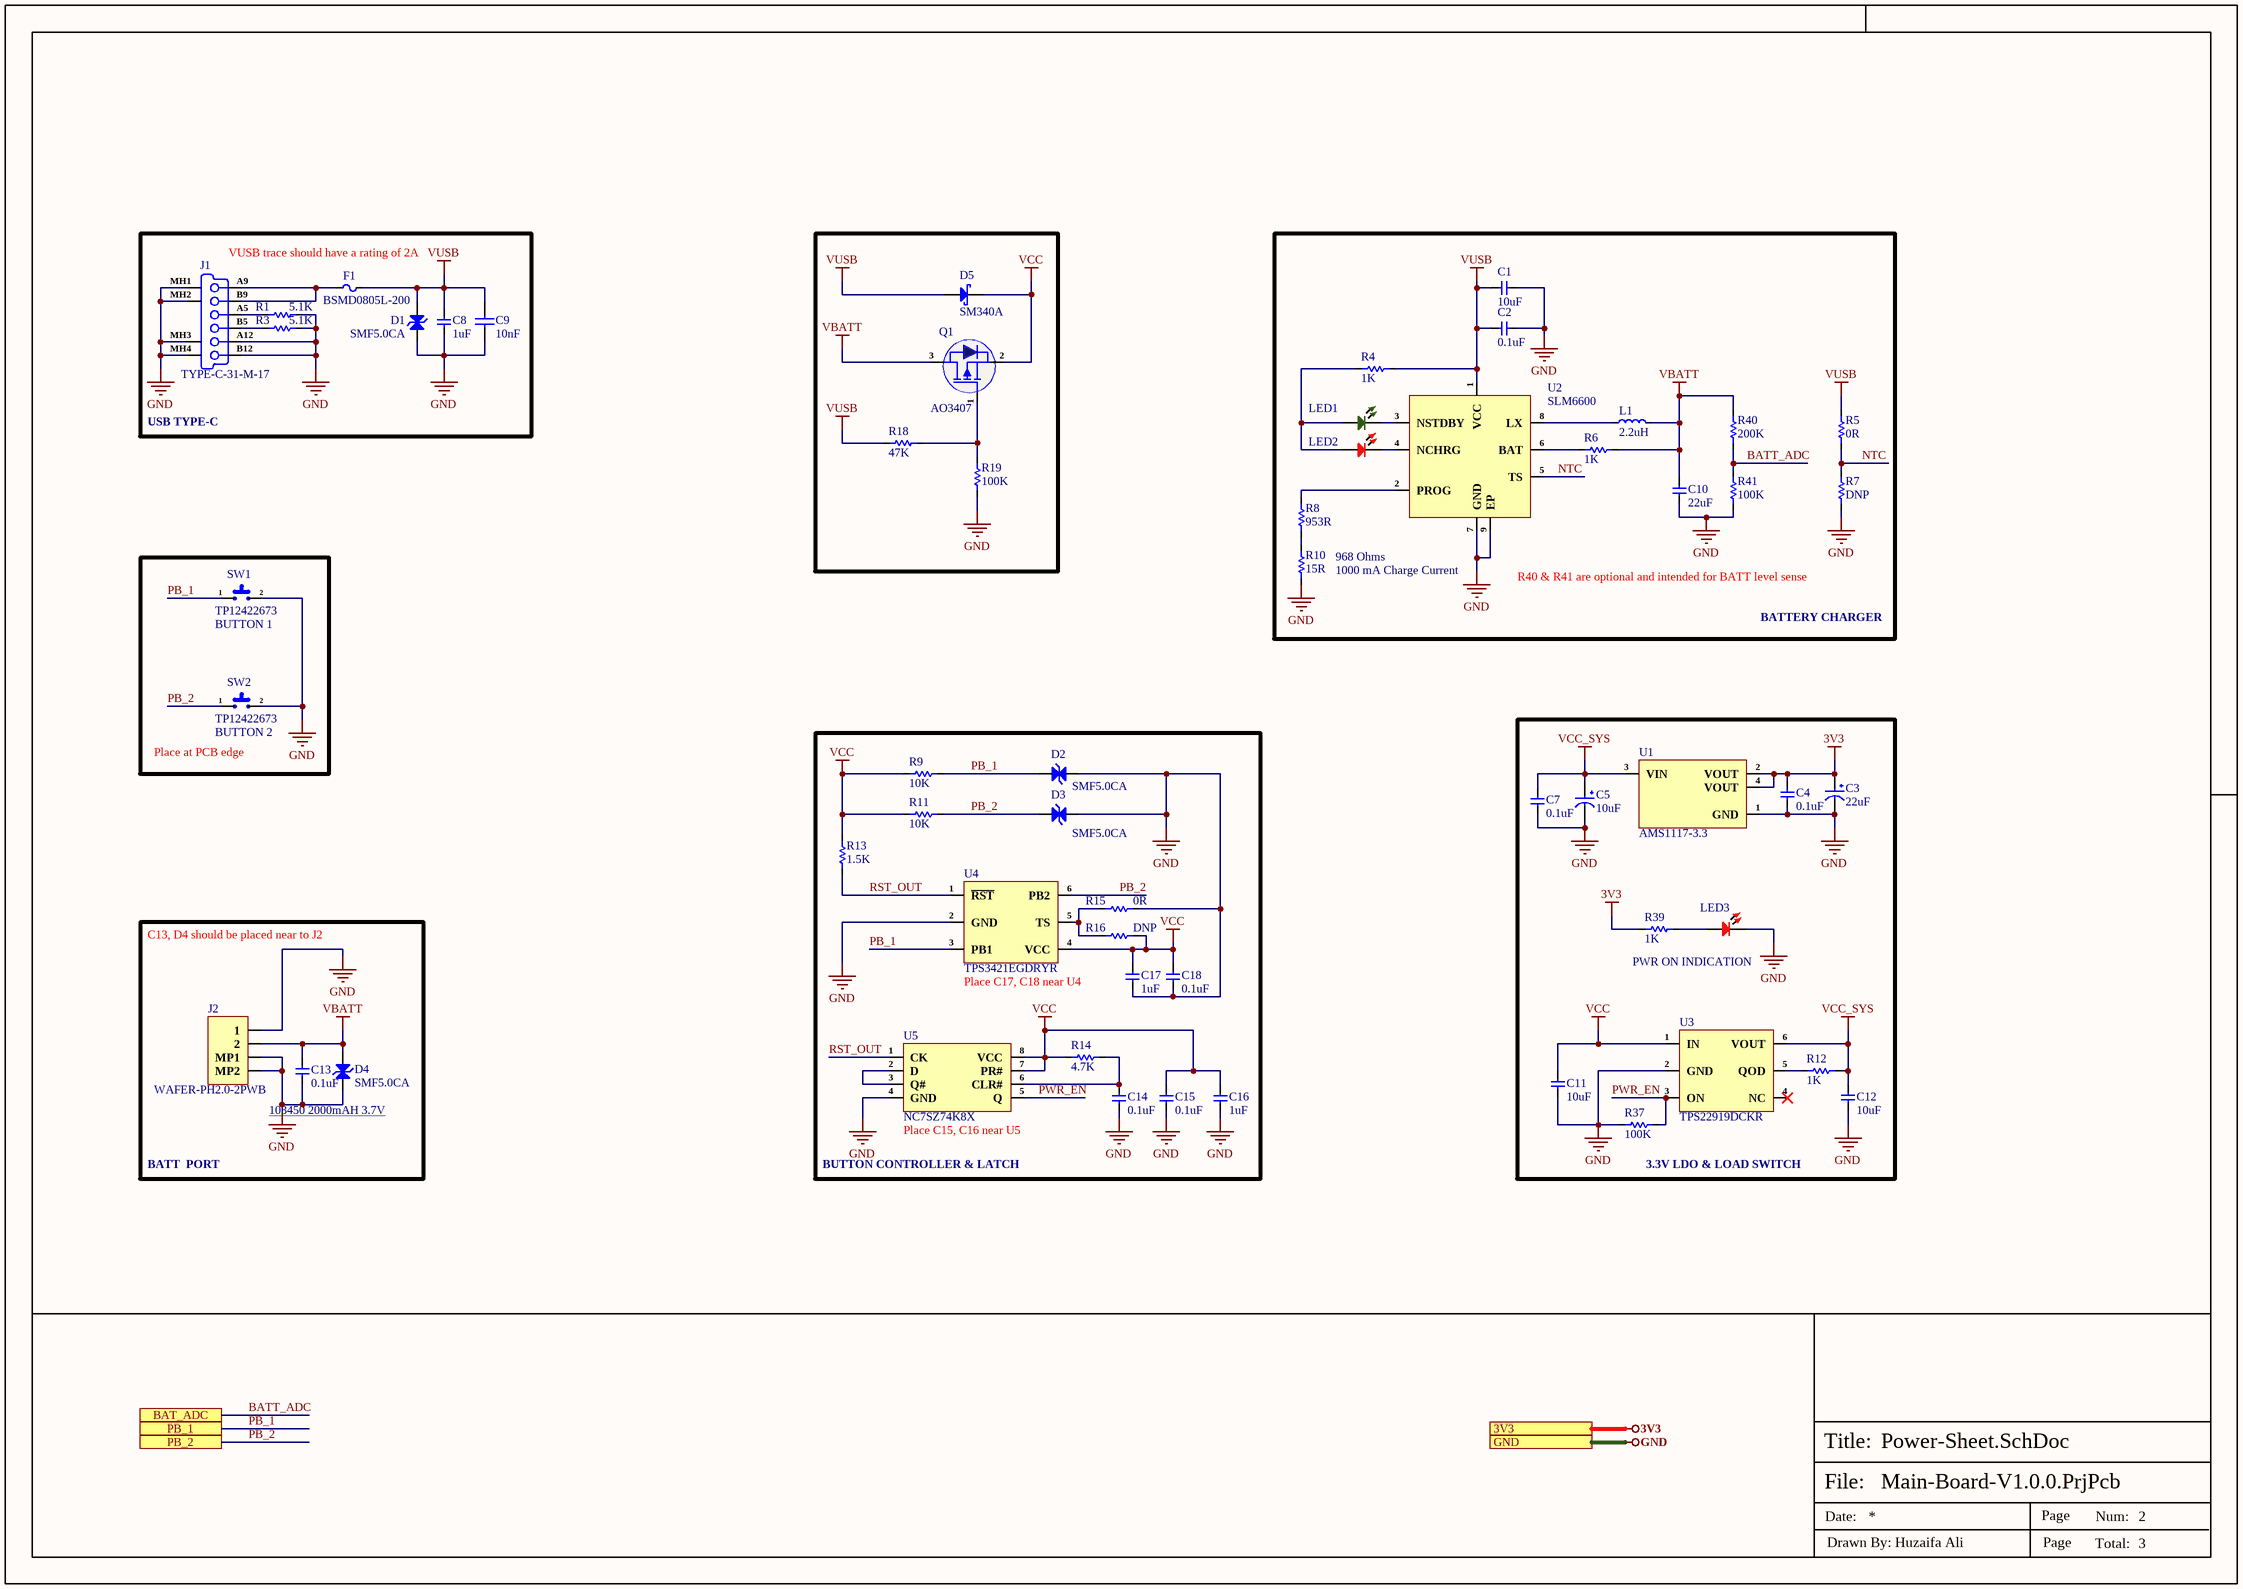
[diagram p2: Power-Sheet.SchDoc]

### Parts
C1  10uF  [Cap-0603]
C2  0.1uF  [Cap-0402]
C3  22uF  [Tant-0805]
C4  0.1uF  [Cap-0402]
C5  10uF  [Tant-0603]
C7  0.1uF  [Cap-0402]
C8  1uF  [Cap-0603]
C9  10nF  [Cap-0603]
C10  22uF  [Cap-0805]
C11  10uF  [Cap-0603]
C12  10uF  [Cap-0603]
C13  0.1uF  [Cap-0402]
C14  0.1uF  [Cap-0402]
C15  0.1uF  [Cap-0402]
C16  1uF  [Cap-0603]
C17  1uF  [Cap-0603]
C18  0.1uF  [Cap-0402]
D1  SMF5.0CA  [SOD-123 (Bi-Directional)]
D2  SMF5.0CA  [SOD-123 (Bi-Directional)]
D3  SMF5.0CA  [SOD-123 (Bi-Directional)]
D4  SMF5.0CA  [SOD-123 (Bi-Directional)]
D5  SM340A  [SMA]
F1  BSMD0805L-200  [Fuse-0805]
J1  TYPE-C-31-M-17  [TYPE-C-31-M-17_]
J2  WAFER-PH2.0-2PWB  [WAFER-PH2.0-2PWB]
L1  2.2uH  [YSPI0520-2R2M_]
LED1  XZVG68W-2  [LED-0402]  (value not drawn)
LED2  Red  [LED-0402]  (value not drawn)
LED3  Red  [LED-0402]  (value not drawn)
Q1  AO3407  [SOT-23]
R1  5.1K  [Res-0603]
R3  5.1K  [Res-0603]
R4  1K  [Res-0402]
R5  0R  [Res-0603]
R6  1K  [RES-0805]
R7  DNP  [Res-0603]
R8  953R  [Res-0603]
R9  10K  [Res-0402]
R10  15R  [Res-0603]
R11  10K  [Res-0402]
R12  1K  [Res-0603]
R13  1.5K  [Res-0402]
R14  4.7K  [Res-0402]
R15  0R  [Res-0603]
R16  DNP  [Res-0603]
R18  47K  [Res-0402]
R19  100K  [Res-0402]
R37  100K  [Res-0402]
R39  1K  [Res-0402]
R40  200K  [Res-0402]
R41  100K  [Res-0402]
SW1  TP12422673  [TP12422673]
SW2  TP12422673  [TP12422673]
U1  AMS1117-3.3  [SOT- 223]
U2  SLM6600  [8-SO-EP_]
U3  TPS22919DCKR  [SC-70-6]
U4  TPS3421EGDRYR  [6-SON (1.45x1)]
U5  NC7SZ74K8X  [VFSOP-8-2.3mm]

### Ports
3V3 (see Top_Sheet[2B], Controller-Sheet[4D]), BAT_ADC (see Top_Sheet[3B], Controller-Sheet[1D]), GND (see Top_Sheet[2B], Controller-Sheet[4D]), PB_1 (see Top_Sheet[3B], Controller-Sheet[1D]), PB_2 (see Top_Sheet[3B], Controller-Sheet[1D])

### Nets
3V3: C3.1 C4.2 R39.1 U1.2(VOUT) U1.4(VOUT) ; port 3V3
GND: C1.1 C2.1 C3.2 C4.1 C5.2 C7.1 C8.1 C9.1 C10.1 C11.2 C12.2 C13.1 C14.1 C15.1 C16.1 C17.1 C18.1 D1.1(A) D2.1(A) D3.1(A) D4.1(A) J1.A12(GND) J1.B12(GND) J1.MH1(Tab) J1.MH2(Tab) J1.MH3(Tab) J1.MH4(Tab) J2.1 J2.MP1 J2.MP2 LED3.2 R1.2 R3.2 R7.1 R10.1 R15.2 R19.1 R37.1 R41.2 SW1.2 SW2.2 U1.1(GND) U2.7(GND) U2.9(EP) U3.2(GND) U4.2(GND) U5.4(GND) ; port GND
VBATT: C10.2 C13.2 D4.2(K) J2.2 L1.2 Q1.3(D) R6.2 R40.2
VCC: C11.1 C15.2 C16.2 C17.2 C18.2 D5.1(K) Q1.2(S) R9.2 R11.2 R13.2 R14.1 R16.2 U3.1(IN) U4.4(VCC) U5.7(PR#) U5.8(VCC)
VCC_SYS: C5.1 C7.2 C12.1 R12.2 U1.3(VIN) U3.6(VOUT)
VUSB: C1.2 C2.2 C8.2 C9.2 D1.2(K) D5.2(A) F1.2 R4.2 R5.2 R18.1 U2.1(VCC)
BATT_ADC: R40.1 R41.1 ; port BAT_ADC
NTC: R5.1 R7.2 U2.5(TS)
PB_1: D2.2(K) R9.1 SW1.1 U4.3(PB1) ; port PB_1
PB_2: D3.2(K) R11.1 SW2.1 U4.6(PB2) ; port PB_2
PWR_EN: R37.2 U3.3(ON) U5.5(Q)
RST_OUT: R13.1 U4.1(~{RST}) U5.1(CK)
NetC14_2: C14.2 R14.2 U5.6(CLR#)
NetF1_1: F1.1 J1.A9(VBUS) J1.B9(VBUS)
NetJ1_A5: J1.A5(CC1) R1.1
NetJ1_B5: J1.B5(CC2) R3.1
NetL1_1: L1.1 U2.8(LX)
NetLED1_1: LED1.1 LED2.1 R4.1
NetLED1_2: LED1.2 U2.3(NSTDBY)
NetLED2_2: LED2.2 U2.4(NCHRG)
NetLED3_1: LED3.1 R39.2
NetQ1_1: Q1.1(G) R18.2 R19.2
NetR6_1: R6.1 U2.6(BAT)
NetR8_1: R8.1 R10.2
NetR8_2: R8.2 U2.2(PROG)
NetR12_1: R12.1 U3.5(QOD)
NetR15_1: R15.1 R16.1 U4.5(TS)
NetU5_2: U5.2(D) U5.3(Q#)

Not connected (* = marked no-connect by the designer): U3 4(NC)*

### Notes on the sheet
- VUSB trace should have a rating of 2A
- USB TYPE-C
- 968 Ohms
- 1000 mA Charge Current
- R40 & R41 are optional and intended for BATT level sense
- (near SW1) BUTTON 1
- BATTERY CHARGER
- (near SW2) Place at PCB edge
- (near SW2) BUTTON 2
- C13, D4 should be placed near to J2
- Place C17, C18 near U4
- PWR ON INDICATION
- 103450 2000mAH 3.7V <https://www.aliexpress.us/item/3256807956783673.html?spm=a2g0o.detail.pcDetailTopMoreOtherSeller.7.c89ceBe2eBe2yp&gps-id=pcDetailTopMoreOtherSeller&scm=1007.40196.417130.0&scm_id=1007.40196.417130.0&scm-url=1007.40196.417130.0&pvid=267ca87e-568d-4cf5-8ec2-89fa39d64639&_t=gps-id%3ApcDetailTopMoreOtherSeller%2Cscm-url%3A1007.40196.417130.0%2Cpvid%3A267ca87e-568d-4cf5-8ec2-89fa39d64639%2Ctpp_buckets%3A668%232846%238112%231997&pdp_npi=4%40dis%21USD%2111.34%216.81%21%21%2182.38%2149.43%21%4021015b2417350288432825182e91ba%2112000043969771197%21rec%21US%21%21ABXZ&utparam-url=scene%3ApcDetailTopMoreOtherSeller%7Cquery_from%3A&gatewayAdapt=glo2usa>
- (near U5) Place C15, C16 near U5
- BATT  PORT
- BUTTON CONTROLLER & LATCH
- (near R37) 3.3V LDO & LOAD SWITCH
- File:
- Title:
- Date:
- Page
- Num:
- Total:
- Drawn By: Huzaifa Ali